# Altium schematic sheet push-button-switch-14.SchDoc
size A4; SheetNumber: 14; SheetTotal: 17
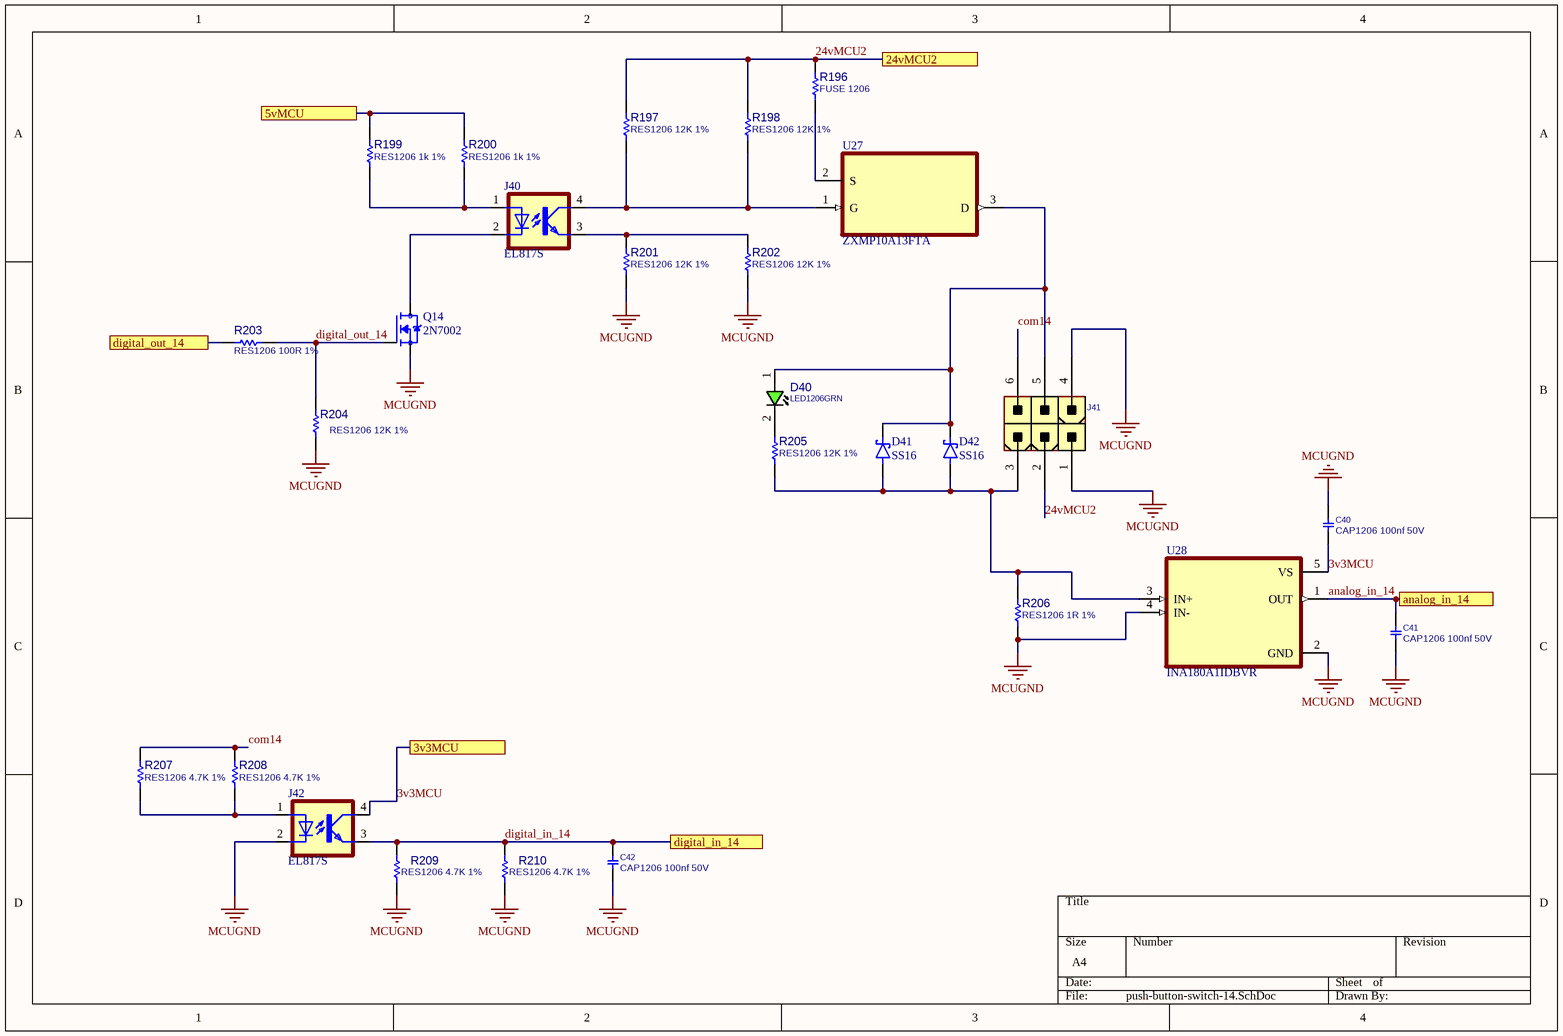
[diagram p0: push-button-switch-14.SchDoc]

## Parts
C40  CAP1206 100nf 50V  [C1206]
C41  CAP1206 100nf 50V  [C1206]
C42  CAP1206 100nf 50V  [C1206]
D40  LED1206GRN  [LED1206GRN]
D41  SS16  [DIOM4325X250N]
D42  SS16  [DIOM4325X250N]
J40  EL817S  [SOIC254P1030X460-4N]
J41  CONN_ATXPWR_6  [ATXPWR_6]  (value not drawn)
J42  EL817S  [SOIC254P1030X460-4N]
Q14  2N7002  [SOT95P240X111-3N]
R196  FUSE 1206  [R1206]
R197  RES1206 12K 1%  [R1206]
R198  RES1206 12K 1%  [R1206]
R199  RES1206 1k 1%  [R1206]
R200  RES1206 1k 1%  [R1206]
R201  RES1206 12K 1%  [R1206]
R202  RES1206 12K 1%  [R1206]
R203  RES1206 100R 1%  [R1206]
R204  RES1206 12K 1%  [R1206]
R205  RES1206 12K 1%  [R1206]
R206  RES1206 1R 1%  [R1206]
R207  RES1206 4.7K 1%  [R1206]
R208  RES1206 4.7K 1%  [R1206]
R209  RES1206 4.7K 1%  [R1206]
R210  RES1206 4.7K 1%  [R1206]
U27  ZXMP10A13FTA  [SOT95P230X110-3N]
U28  INA180A1IDBVR  [SOT95P280X145-5N]

## Ports
3v3MCU, 5vMCU, 24vMCU2, analog_in_14, digital_in_14, digital_out_14

## Nets
MCUGND: C40.1 C41.2 C42.2 J41.1 J41.4 J42.2(C) Q14.2(S) R201.2 R202.2 R204.2 R206.2 R209.1 R210.1 U28.2(GND) U28.4(IN-)
3v3MCU: C40.2 J42.4(COL) U28.5(VS) ; port 3v3MCU
5vMCU: R199.2 R200.2 ; port 5vMCU
24vMCU2: J41.2 R196.1 R197.1 R198.1 ; port 24vMCU2
analog_in_14: C41.1 U28.1(OUT) ; port analog_in_14
com14: J41.6 R207.2 R208.2
digital_in_14: C42.1 J42.3(EMIT) R209.2 R210.2 ; port digital_in_14
digital_out_14: Q14.1(G) R203.2 R204.1
digital_out_14: R203.1 ; port digital_out_14  [a separate net that carries the same name]
NetD40_1: D40.1(ANODE) D41.C(K) D42.C(K) J41.5 U27.3(D)
NetD40_2: D40.2(CATHODE) R205.1
NetD41_A: D41.A D42.A J41.3 R205.2 R206.1 U28.3(IN+)
NetJ40_1: J40.1(A) R199.1 R200.1
NetJ40_2: J40.2(C) Q14.3(D)
NetJ40_3: J40.3(EMIT) R201.1 R202.1
NetJ40_4: J40.4(COL) R197.2 R198.2 U27.1(G)
NetJ42_1: J42.1(A) R207.1 R208.1
NetR196_2: R196.2 U27.2(S)

## Library data of the parts
C40-C42 = CAP_SMD_MLCC_1206: CAP, MLCC; PARAM: -, -%; MANF_P#: MANF_PART#; PARAM2: -V; PRICE: 100= 1$; MANF: -; ASSEMBLY: ASSEMBLY
D40 = LED_SMD_1206_GRN: LED, SMD, 1206, GREEN; PARAM: 20mA; DESC: DESCRIPTION; PARAM2: 2.2V; MANF: -; ASSEMBLY: ASSEMBLY; PRICE: 36t@Javan; MANF_P#: -; VALUE: LED1206GRN; MountType: SMT; PartType: LED
D41 D42 = SS14: 1A, 40V, Schottky Rectifier; MF: Taiwan Semiconductor; SnapEDA_Link: https://www.snapeda.com/parts/SS14/taiwan/view-part/?ref=snap; Package: SMA-2 Taiwan Semiconductor; Value: *; MP: SS14; Check_prices: https://www.snapeda.com/parts/SS14/taiwan/view-part/?ref=eda
J40 J42 = EL817S: Optoisolator Transistor Output 5000Vrms 1 Channel 4-SMD; MF: Everlight Electronics; SnapEDA_Link: https://www.snapeda.com/parts/EL817S/Everlight+Electronics+Co+Ltd/view-part/?ref=snap; Package: SMD-4 Everlight Electronics Co Ltd; Value: *; MP: EL817S; Check_prices: https://www.snapeda.com/parts/EL817S/Everlight+Electronics+Co+Ltd/view-part/?ref=eda
J41 = CONN_ATXPWR_6: CONN, ATX POWER, 6 P; MANF: TE; MANF_P#: 4-1775099-1; VALUE: CONN_ATXPWR_6; MountType: THD; PACKAGE: ATXPWR-6pin; Part Type: Conn.
Q14 = 2N7002: N-Channel 60V 280mA (Ta) 350mW (Ta) Surface Mount SOT-23-3 (TO-236); MF: {'manufacturer': u'onsemi'}; Package: None; Price: None; Value: *; MP: 2N7002; Availability: Unavailable
R196-R210 = RES_SMD_1206: RESISTOR, SMD; PARAM: 1%, 0.25W; DESC: DESCRIPTION; DIST#: MOUSER; MANF_P#: -; MANF: -; ASSEMBLY: ASSEMBLY; PRICE: -; PARAM2: -
U27 = ZXMP10A13FTA: P-Channel 100 V 600mA (Ta) 625mW (Ta) Surface Mount SOT-23-3; MF: Diodes Inc.; Purchase-URL: https://pricing.snapeda.com/search/part/ZXMP10A13FTA/?ref=eda; Package: SOT-23-3 Diodes Inc.; SnapEDA_Link: https://www.snapeda.com/parts/ZXMP10A13FTA/Diodes+Inc./view-part/?ref=snap; Availability: In Stock; Value: *; MP: ZXMP10A13FTA; Check_prices: https://www.snapeda.com/parts/ZXMP10A13FTA/Diodes+Inc./view-part/?ref=eda; Price: None
U28 = INA180A1IDBVR: 26V, 350kHz current sense amplifier; MF: Texas Instruments; SnapEDA_Link: https://www.snapeda.com/parts/INA180A1IDBVR/Texas+Instruments/view-part/?ref=snap; Package: SOT-23-5 Texas Instruments; Value: *; MP: INA180A1IDBVR; Check_prices: https://www.snapeda.com/parts/INA180A1IDBVR/Texas+Instruments/view-part/?ref=eda